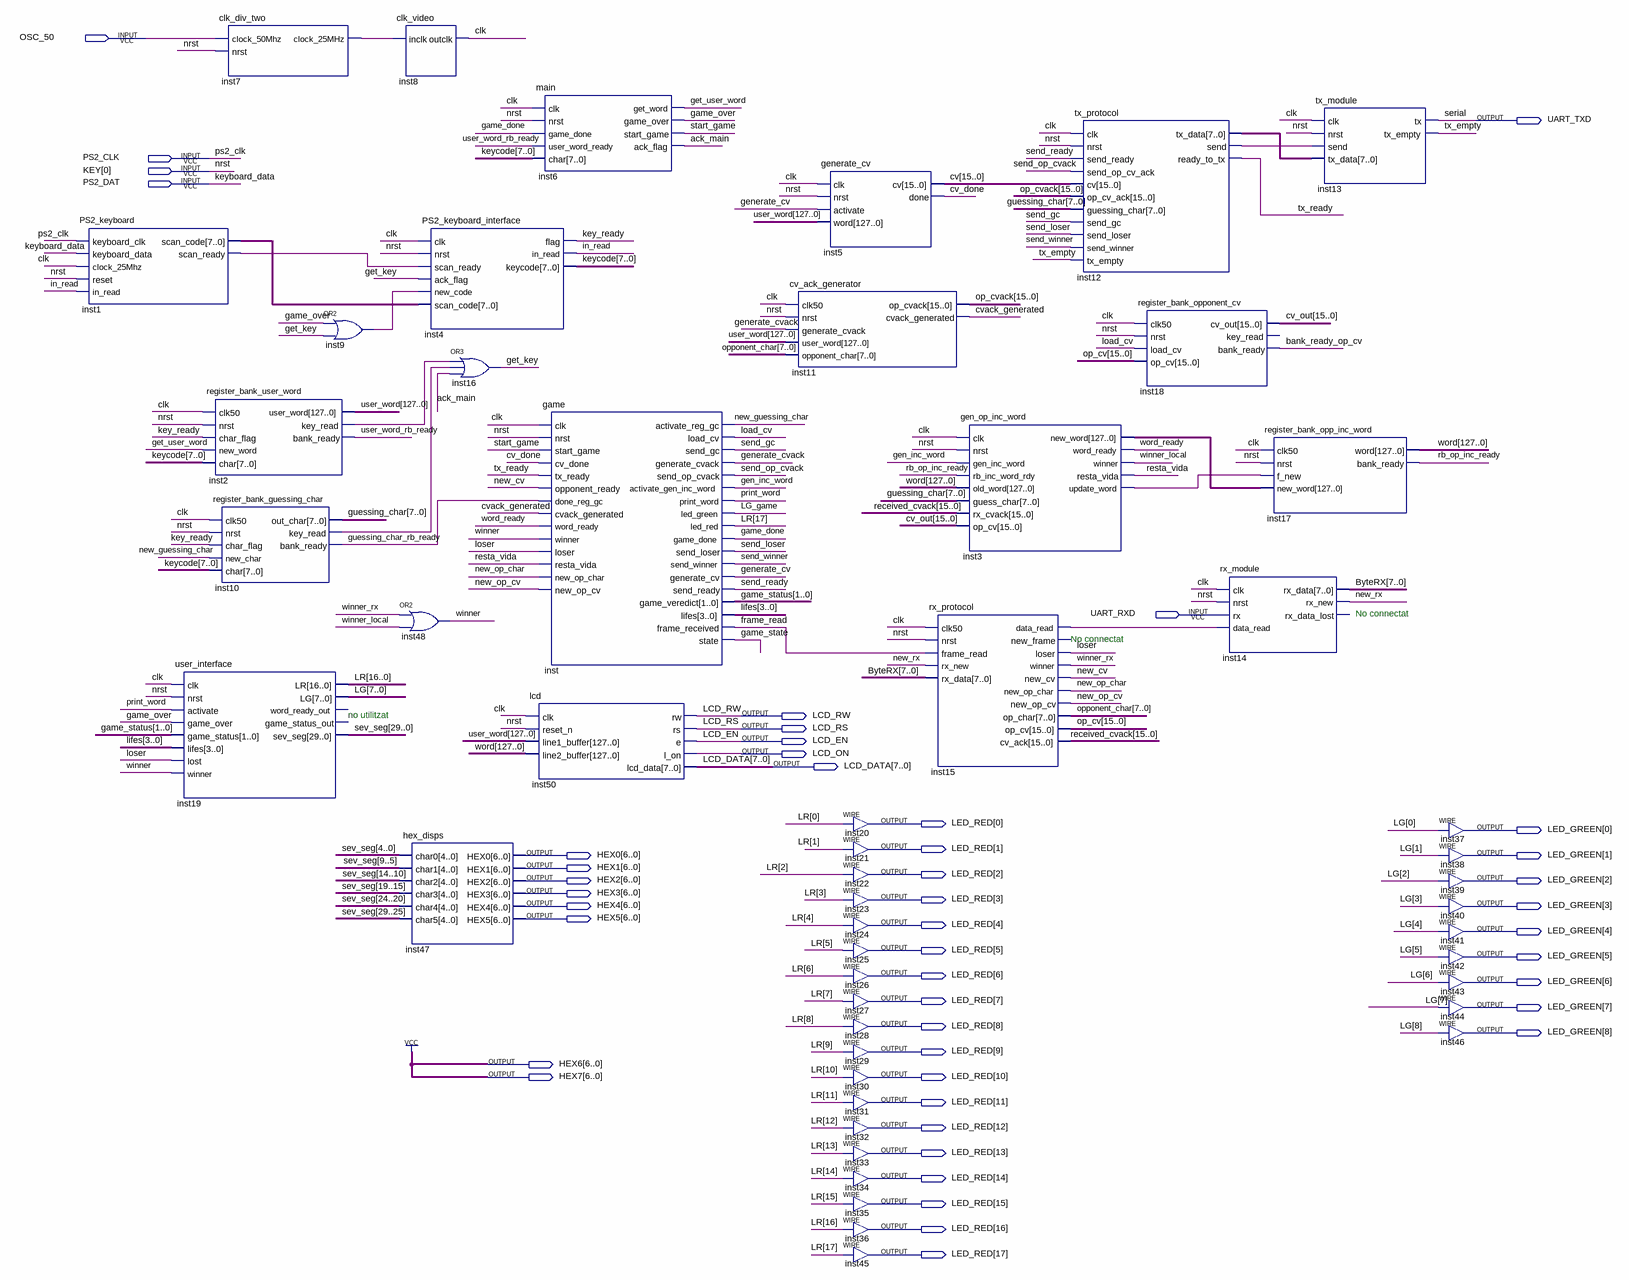
[diagram p0: schematic sheet]
// Quartus schematic hangman.bdf as structural Verilog: 50 symbols, 46 pins
module hangman (
  input  OSC_50,
  input  PS2_CLK,
  input  [0:0] KEY,
  input  PS2_DAT,
  input  UART_RXD,
  output UART_TXD,
  output LCD_RW,
  output LCD_RS,
  output LCD_EN,
  output LCD_ON,
  output [7:0] LCD_DATA,
  output [17:0] LED_RED,
  output [8:0] LED_GREEN,
  output [6:0] HEX0,
  output [6:0] HEX1,
  output [6:0] HEX2,
  output [6:0] HEX3,
  output [6:0] HEX4,
  output [6:0] HEX5,
  output [6:0] HEX6,
  output [6:0] HEX7
);

  wire ack_main, bank_ready_op_cv, clk, cv_done, cvack_generated, frame_read, game_done, game_over,
       game_state, gen_inc_word, generate_cv, generate_cvack, get_key, get_user_word, guessing_char_rb_ready,
       in_read, inst1_scan_ready, inst2_key_read, inst3_update_word, inst7_clock_25mhz, inst9_out,
       inst10_key_read, inst12_send, inst15_data_read, key_ready, LG_game, load_cv, loser, new_cv,
       new_guessing_char, new_op_char, new_op_cv, new_rx, print_word, rb_op_inc_ready, resta_vida, send_gc,
       send_loser, send_op_cvack, send_ready, send_winner, start_game, tx_empty, tx_ready,
       user_word_rb_ready, winner, winner_local, winner_rx, word_ready;
  wire [1:0] game_status;
  wire [3:0] lifes;
  wire [7:0] ByteRX, guessing_char, inst1_scan_code, inst12_tx_data, keycode, opponent_char;
  wire [8:0] LG;
  wire [15:0] cv, cv_out, op_cv, op_cvack, received_cvack;
  wire [17:0] LR;
  wire [29:0] sev_seg;
  wire [127:0] inst3_new_word, user_word, word;

  PS2_keyboard inst1 (
    .keyboard_clk(PS2_CLK), .keyboard_data(PS2_DAT), .clock_25Mhz(clk), .reset(KEY[0]), .in_read(in_read),
    .scan_code(inst1_scan_code), .scan_ready(inst1_scan_ready));
  user_interface inst19 (
    .clk(clk), .nrst(KEY[0]), .activate(print_word), .game_over(game_over), .game_status(game_status),
    .lifes(lifes), .lost(loser), .winner(winner), .LR(LR[16:0]), .LG(LG[7:0]), .sev_seg(sev_seg));  // open: word_ready_out, game_status_out
  clk_div_two inst7 (.clock_50Mhz(OSC_50), .nrst(KEY[0]), .clock_25MHz(inst7_clock_25mhz));
  register_bank_user_word inst2 (
    .clk50(clk), .nrst(KEY[0]), .char_flag(key_ready), .new_word(get_user_word), .char(keycode),
    .user_word(user_word), .key_read(inst2_key_read), .bank_ready(user_word_rb_ready));
  register_bank_guessing_char inst10 (
    .clk50(clk), .nrst(KEY[0]), .char_flag(key_ready), .new_char(new_guessing_char), .char(keycode),
    .out_char(guessing_char), .key_read(inst10_key_read), .bank_ready(guessing_char_rb_ready));
  or inst9 (inst9_out, game_over, get_key);
  clk_video inst8 (.inclk(inst7_clock_25mhz), .outclk(clk));
  PS2_keyboard_interface inst4 (
    .clk(clk), .nrst(KEY[0]), .scan_ready(inst1_scan_ready), .ack_flag(get_key), .new_code(inst9_out),
    .scan_code(inst1_scan_code), .flag(key_ready), .in_read(in_read), .keycode(keycode));
  or inst48 (winner, winner_rx, winner_local);
  hex_disps inst47 (
    .char0(sev_seg[4:0]), .char1(sev_seg[9:5]), .char2(sev_seg[14:10]), .char3(sev_seg[19:15]),
    .char4(sev_seg[24:20]), .char5(sev_seg[29:25]), .HEX0(HEX0), .HEX1(HEX1), .HEX2(HEX2), .HEX3(HEX3),
    .HEX4(HEX4), .HEX5(HEX5));
  or inst16 (get_key, inst2_key_read, inst10_key_read, ack_main);
  main inst6 (
    .clk(clk), .nrst(KEY[0]), .game_done(game_done), .user_word_ready(user_word_rb_ready), .char(keycode),
    .get_word(get_user_word), .game_over(game_over), .start_game(start_game), .ack_flag(ack_main));
  game inst (
    .clk(clk), .nrst(KEY[0]), .start_game(start_game), .cv_done(cv_done), .tx_ready(tx_ready),
    .opponent_ready(new_cv), .done_reg_gc(guessing_char_rb_ready), .cvack_generated(cvack_generated),
    .word_ready(word_ready), .winner(winner), .loser(loser), .resta_vida(resta_vida),
    .new_op_char(new_op_char), .new_op_cv(new_op_cv), .activate_reg_gc(new_guessing_char), .load_cv(load_cv),
    .send_gc(send_gc), .generate_cvack(generate_cvack), .send_op_cvack(send_op_cvack),
    .activate_gen_inc_word(gen_inc_word), .print_word(print_word), .led_green(LG_game), .led_red(LR[17]),
    .game_done(game_done), .send_loser(send_loser), .send_winner(send_winner), .generate_cv(generate_cv),
    .send_ready(send_ready), .game_veredict(game_status), .lifes(lifes), .frame_received(frame_read),
    .state(game_state));
  lcd inst50 (
    .clk(clk), .reset_n(KEY[0]), .line1_buffer(user_word), .line2_buffer(word), .rw(LCD_RW), .rs(LCD_RS),
    .e(LCD_EN), .l_on(LCD_ON), .lcd_data(LCD_DATA));
  cv_ack_generator inst11 (
    .clk50(clk), .nrst(KEY[0]), .generate_cvack(generate_cvack), .user_word(user_word),
    .opponent_char(opponent_char), .op_cvack(op_cvack), .cvack_generated(cvack_generated));
  generate_cv inst5 (.clk(clk), .nrst(KEY[0]), .activate(generate_cv), .word(user_word), .cv(cv), .done(cv_done));
  assign LED_RED[0] = LR[0];  // WIRE inst20
  assign LED_RED[1] = LR[1];  // WIRE inst21
  assign LED_RED[2] = LR[2];  // WIRE inst22
  assign LED_RED[3] = LR[3];  // WIRE inst23
  assign LED_RED[4] = LR[4];  // WIRE inst24
  assign LED_RED[5] = LR[5];  // WIRE inst25
  assign LED_RED[6] = LR[6];  // WIRE inst26
  assign LED_RED[7] = LR[7];  // WIRE inst27
  assign LED_RED[8] = LR[8];  // WIRE inst28
  assign LED_RED[9] = LR[9];  // WIRE inst29
  assign LED_RED[10] = LR[10];  // WIRE inst30
  assign LED_RED[11] = LR[11];  // WIRE inst31
  assign LED_RED[12] = LR[12];  // WIRE inst32
  assign LED_RED[13] = LR[13];  // WIRE inst33
  assign LED_RED[14] = LR[14];  // WIRE inst34
  assign LED_RED[15] = LR[15];  // WIRE inst35
  assign LED_RED[16] = LR[16];  // WIRE inst36
  assign LED_RED[17] = LR[17];  // WIRE inst45
  rx_protocol inst15 (
    .clk50(clk), .nrst(KEY[0]), .frame_read(frame_read), .rx_new(new_rx), .rx_data(ByteRX),
    .data_read(inst15_data_read), .loser(loser), .winner(winner_rx), .new_cv(new_cv),
    .new_op_char(new_op_char), .new_op_cv(new_op_cv), .op_char(opponent_char), .op_cv(op_cv),
    .cv_ack(received_cvack));  // open: new_frame
  gen_op_inc_word inst3 (
    .clk(clk), .nrst(KEY[0]), .gen_inc_word(gen_inc_word), .rb_inc_word_rdy(rb_op_inc_ready),
    .old_word(word), .guess_char(guessing_char), .rx_cvack(received_cvack), .op_cv(cv_out),
    .new_word(inst3_new_word), .word_ready(word_ready), .winner(winner_local), .resta_vida(resta_vida),
    .update_word(inst3_update_word));
  tx_protocol inst12 (
    .clk(clk), .nrst(KEY[0]), .send_ready(send_ready), .send_op_cv_ack(send_op_cvack), .cv(cv),
    .op_cv_ack(op_cvack), .guessing_char(guessing_char), .send_gc(send_gc), .send_loser(send_loser),
    .send_winner(send_winner), .tx_empty(tx_empty), .tx_data(inst12_tx_data), .send(inst12_send),
    .ready_to_tx(tx_ready));
  register_bank_opponent_cv inst18 (
    .clk50(clk), .nrst(KEY[0]), .load_cv(load_cv), .op_cv(op_cv), .cv_out(cv_out),
    .bank_ready(bank_ready_op_cv));  // open: key_read
  rx_module inst14 (
    .clk(clk), .nrst(KEY[0]), .rx(UART_RXD), .data_read(inst15_data_read), .rx_data(ByteRX), .rx_new(new_rx));  // open: rx_data_lost
  register_bank_opp_inc_word inst17 (
    .clk50(clk), .nrst(KEY[0]), .f_new(inst3_update_word), .new_word(inst3_new_word), .word(word),
    .bank_ready(rb_op_inc_ready));
  tx_module inst13 (
    .clk(clk), .nrst(KEY[0]), .send(inst12_send), .tx_data(inst12_tx_data), .tx(UART_TXD), .tx_empty(tx_empty));
  assign LED_GREEN[0] = LG[0];  // WIRE inst37
  assign LED_GREEN[1] = LG[1];  // WIRE inst38
  assign LED_GREEN[2] = LG[2];  // WIRE inst39
  assign LED_GREEN[3] = LG[3];  // WIRE inst40
  assign LED_GREEN[4] = LG[4];  // WIRE inst41
  assign LED_GREEN[5] = LG[5];  // WIRE inst42
  assign LED_GREEN[6] = LG[6];  // WIRE inst43
  assign LED_GREEN[7] = LG[7];  // WIRE inst44
  assign LED_GREEN[8] = LG[8];  // WIRE inst46

  assign HEX6 = {7{1'b1}};
  assign HEX7 = {7{1'b1}};

  // Other names for the same wires on the sheet: keyboard_data = PS2_DAT; nrst = KEY[0]; serial = UART_TXD

  // Notes on the sheet:
  //   No connectat
  //   No connectat
  //   no utilitzat
endmodule
